# Altium schematic sheet 04_DRAM-LPDDR4X_200P_1X32bit.SchDoc
size 594 x 420 mm; SheetNumber: 4; SheetTotal: 10
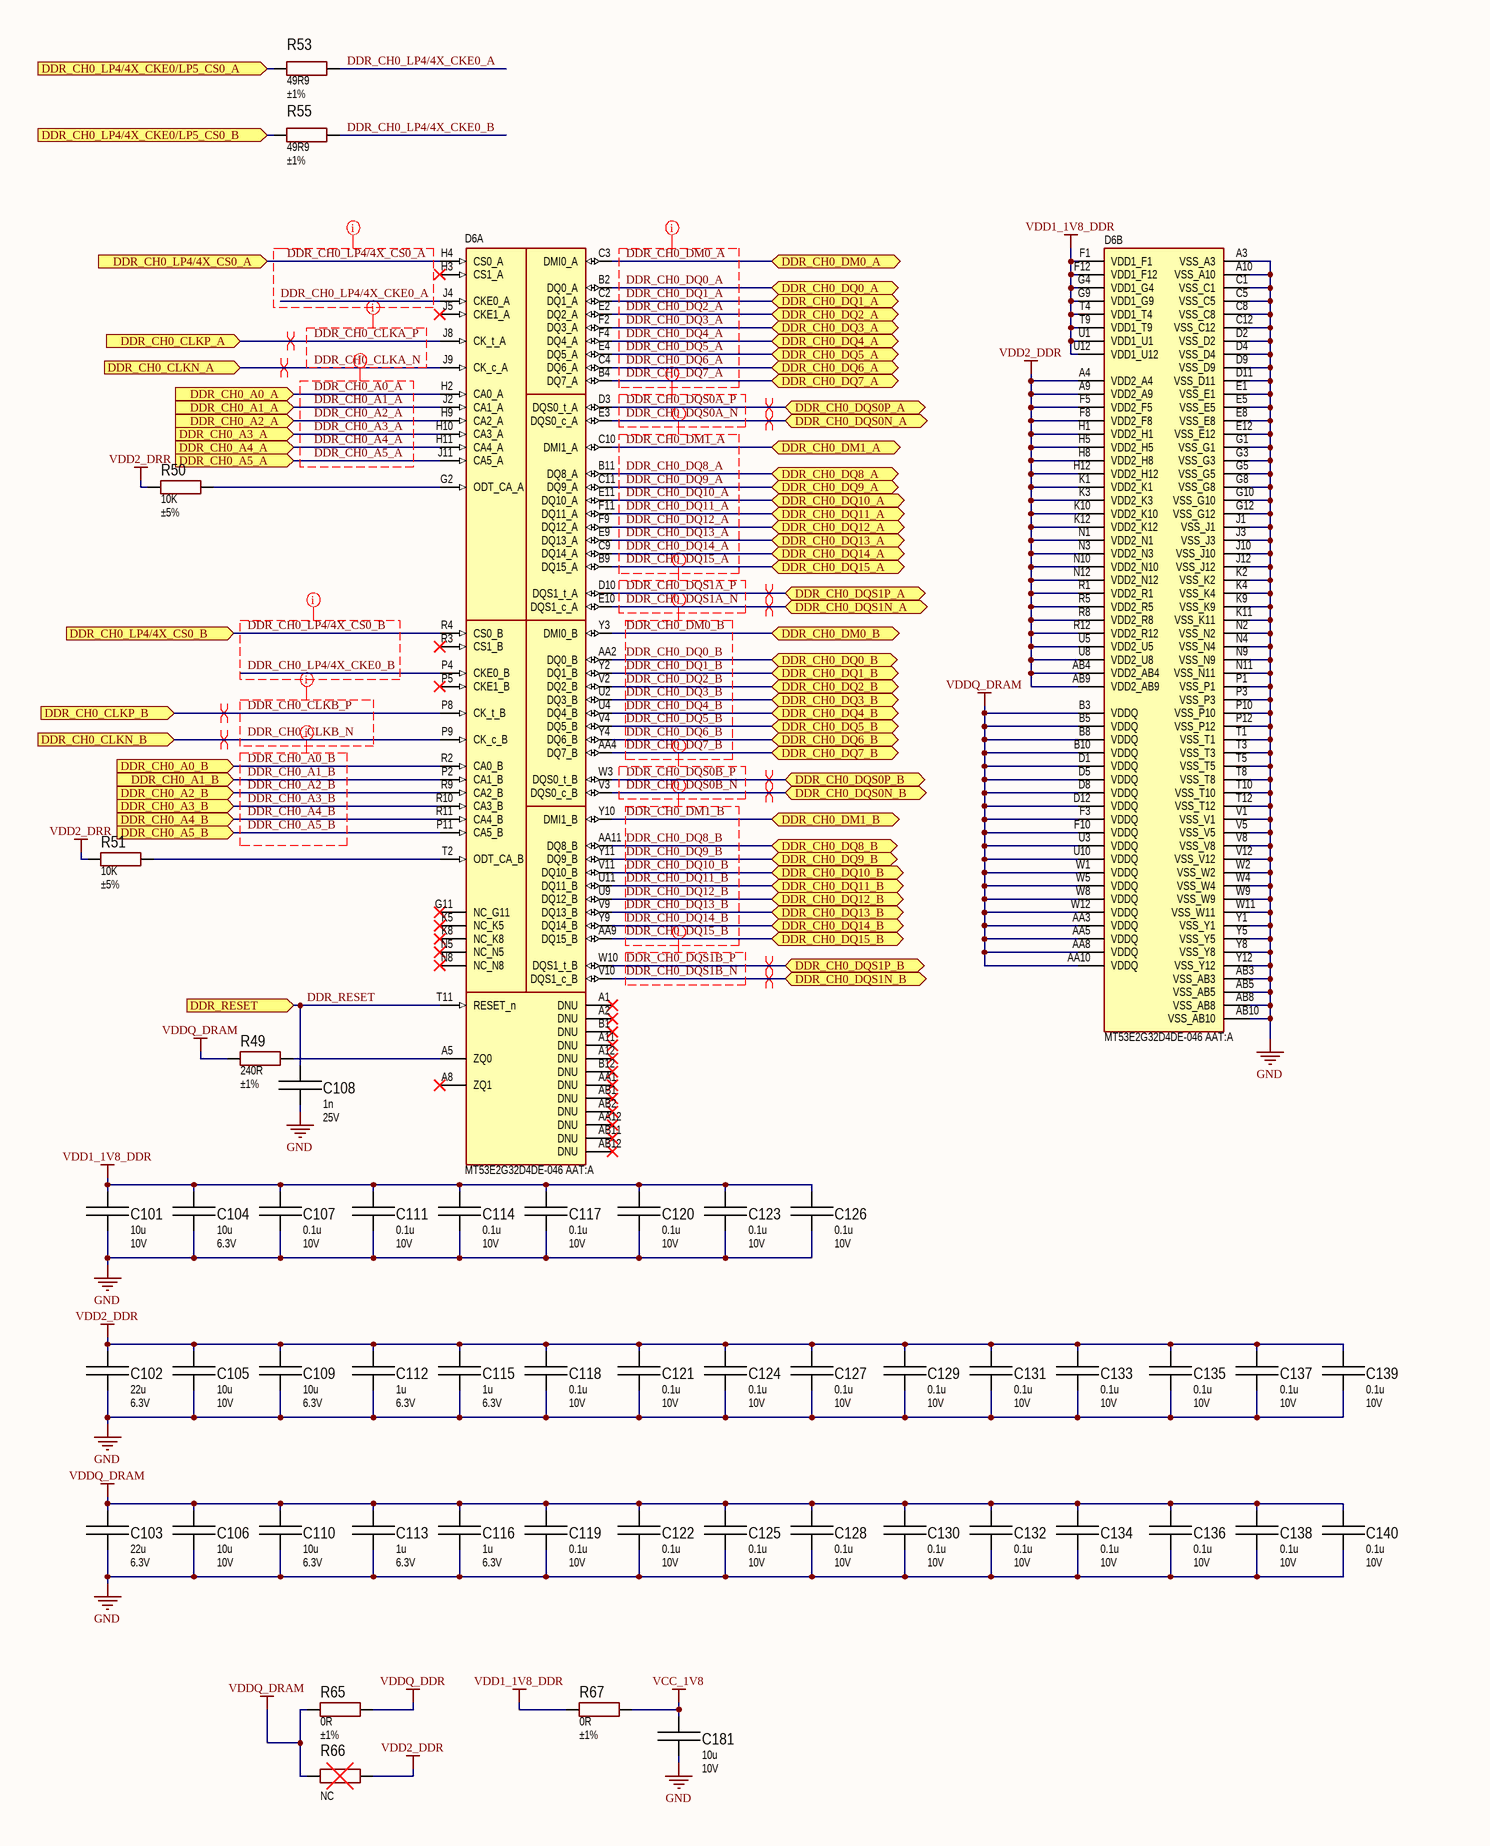
[diagram p0: 04_DRAM-LPDDR4X_200P_1X32bit.SchDoc, left]
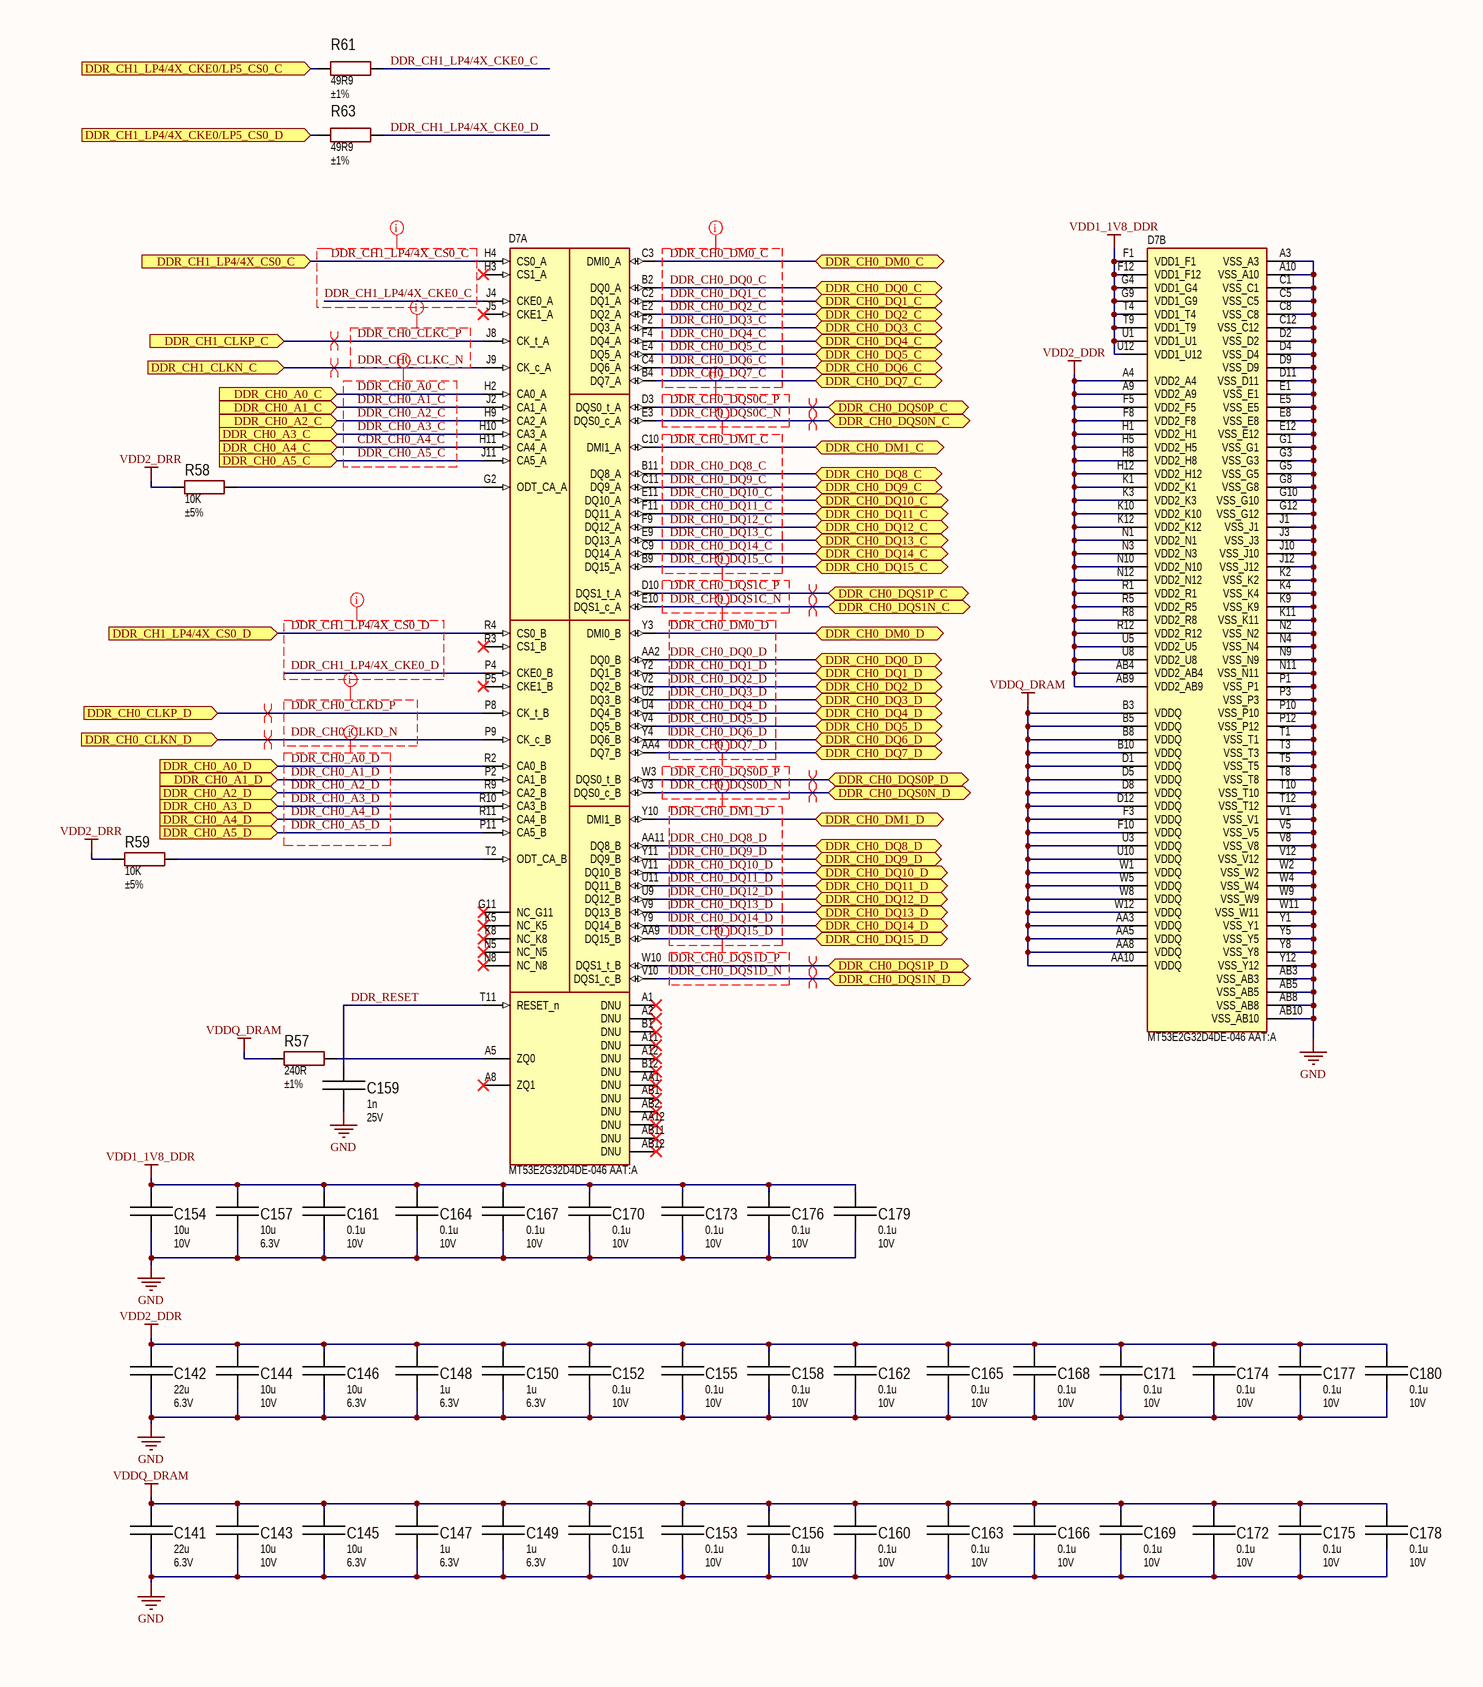
[diagram p1: 04_DRAM-LPDDR4X_200P_1X32bit.SchDoc, right]

## Parts
C101  value 10u  Voltage: 10V  [CAPC1608X08N]  (hidden comment: C1608X5R1A106K080AC)
C102  value 22u  Voltage: 6.3V  [CAPC1608X08N]  (hidden comment: C1608X5R0J226M080AC)
C103  value 22u  Voltage: 6.3V  [CAPC1608X08N]  (hidden comment: C1608X5R0J226M080AC)
C104  value 10u  Voltage: 6.3V  [CAPC1608X08N]  (hidden comment: C1608X5R0J106K080AB)
C105  value 10u  Voltage: 10V  [CAPC1608X08N]  (hidden comment: C1608X5R1A106K080AC)
C106  value 10u  Voltage: 10V  [CAPC1608X08N]  (hidden comment: C1608X5R1A106K080AC)
C107  value 0.1u  Voltage: 10V  [CAPC0603X03N]  (hidden comment: C0603X5R1A104K030BC)
C108  value 1n  Voltage: 25V  [CAPC0603X03N]  (hidden comment: C0603X5R1E102K030BA)
C109  value 10u  Voltage: 6.3V  [CAPC1608X08N]  (hidden comment: C1608X5R0J106K080AB)
C110  value 10u  Voltage: 6.3V  [CAPC1608X08N]  (hidden comment: C1608X5R0J106K080AB)
C111  value 0.1u  Voltage: 10V  [CAPC0603X03N]  (hidden comment: C0603X5R1A104K030BC)
C112  value 1u  Voltage: 6.3V  [CAPC1005X06N]  (hidden comment: C1005X5R0J105K050BB)
C113  value 1u  Voltage: 6.3V  [CAPC1005X06N]  (hidden comment: C1005X5R0J105K050BB)
C114  value 0.1u  Voltage: 10V  [CAPC0603X03N]  (hidden comment: C0603X5R1A104K030BC)
C115  value 1u  Voltage: 6.3V  [CAPC1005X06N]  (hidden comment: C1005X5R0J105K050BB)
C116  value 1u  Voltage: 6.3V  [CAPC1005X06N]  (hidden comment: C1005X5R0J105K050BB)
C117  value 0.1u  Voltage: 10V  [CAPC0603X03N]  (hidden comment: C0603X5R1A104K030BC)
C118  value 0.1u  Voltage: 10V  [CAPC0603X03N]  (hidden comment: C0603X5R1A104K030BC)
C119  value 0.1u  Voltage: 10V  [CAPC0603X03N]  (hidden comment: C0603X5R1A104K030BC)
C120  value 0.1u  Voltage: 10V  [CAPC0603X03N]  (hidden comment: C0603X5R1A104K030BC)
C121  value 0.1u  Voltage: 10V  [CAPC0603X03N]  (hidden comment: C0603X5R1A104K030BC)
C122  value 0.1u  Voltage: 10V  [CAPC0603X03N]  (hidden comment: C0603X5R1A104K030BC)
C123  value 0.1u  Voltage: 10V  [CAPC0603X03N]  (hidden comment: C0603X5R1A104K030BC)
C124  value 0.1u  Voltage: 10V  [CAPC0603X03N]  (hidden comment: C0603X5R1A104K030BC)
C125  value 0.1u  Voltage: 10V  [CAPC0603X03N]  (hidden comment: C0603X5R1A104K030BC)
C126  value 0.1u  Voltage: 10V  [CAPC0603X03N]  (hidden comment: C0603X5R1A104K030BC)
C127  value 0.1u  Voltage: 10V  [CAPC0603X03N]  (hidden comment: C0603X5R1A104K030BC)
C128  value 0.1u  Voltage: 10V  [CAPC0603X03N]  (hidden comment: C0603X5R1A104K030BC)
C129  value 0.1u  Voltage: 10V  [CAPC0603X03N]  (hidden comment: C0603X5R1A104K030BC)
C130  value 0.1u  Voltage: 10V  [CAPC0603X03N]  (hidden comment: C0603X5R1A104K030BC)
C131  value 0.1u  Voltage: 10V  [CAPC0603X03N]  (hidden comment: C0603X5R1A104K030BC)
C132  value 0.1u  Voltage: 10V  [CAPC0603X03N]  (hidden comment: C0603X5R1A104K030BC)
C133  value 0.1u  Voltage: 10V  [CAPC0603X03N]  (hidden comment: C0603X5R1A104K030BC)
C134  value 0.1u  Voltage: 10V  [CAPC0603X03N]  (hidden comment: C0603X5R1A104K030BC)
C135  value 0.1u  Voltage: 10V  [CAPC0603X03N]  (hidden comment: C0603X5R1A104K030BC)
C136  value 0.1u  Voltage: 10V  [CAPC0603X03N]  (hidden comment: C0603X5R1A104K030BC)
C137  value 0.1u  Voltage: 10V  [CAPC0603X03N]  (hidden comment: C0603X5R1A104K030BC)
C138  value 0.1u  Voltage: 10V  [CAPC0603X03N]  (hidden comment: C0603X5R1A104K030BC)
C139  value 0.1u  Voltage: 10V  [CAPC0603X03N]  (hidden comment: C0603X5R1A104K030BC)
C140  value 0.1u  Voltage: 10V  [CAPC0603X03N]  (hidden comment: C0603X5R1A104K030BC)
C141  value 22u  Voltage: 6.3V  [CAPC1608X08N]  (hidden comment: C1608X5R0J226M080AC)
C142  value 22u  Voltage: 6.3V  [CAPC1608X08N]  (hidden comment: C1608X5R0J226M080AC)
C143  value 10u  Voltage: 10V  [CAPC1608X08N]  (hidden comment: C1608X5R1A106K080AC)
C144  value 10u  Voltage: 10V  [CAPC1608X08N]  (hidden comment: C1608X5R1A106K080AC)
C145  value 10u  Voltage: 6.3V  [CAPC1608X08N]  (hidden comment: C1608X5R0J106K080AB)
C146  value 10u  Voltage: 6.3V  [CAPC1608X08N]  (hidden comment: C1608X5R0J106K080AB)
C147  value 1u  Voltage: 6.3V  [CAPC1005X06N]  (hidden comment: C1005X5R0J105K050BB)
C148  value 1u  Voltage: 6.3V  [CAPC1005X06N]  (hidden comment: C1005X5R0J105K050BB)
C149  value 1u  Voltage: 6.3V  [CAPC1005X06N]  (hidden comment: C1005X5R0J105K050BB)
C150  value 1u  Voltage: 6.3V  [CAPC1005X06N]  (hidden comment: C1005X5R0J105K050BB)
C151  value 0.1u  Voltage: 10V  [CAPC0603X03N]  (hidden comment: C0603X5R1A104K030BC)
C152  value 0.1u  Voltage: 10V  [CAPC0603X03N]  (hidden comment: C0603X5R1A104K030BC)
C153  value 0.1u  Voltage: 10V  [CAPC0603X03N]  (hidden comment: C0603X5R1A104K030BC)
C154  value 10u  Voltage: 10V  [CAPC1608X08N]  (hidden comment: C1608X5R1A106K080AC)
C155  value 0.1u  Voltage: 10V  [CAPC0603X03N]  (hidden comment: C0603X5R1A104K030BC)
C156  value 0.1u  Voltage: 10V  [CAPC0603X03N]  (hidden comment: C0603X5R1A104K030BC)
C157  value 10u  Voltage: 6.3V  [CAPC1608X08N]  (hidden comment: C1608X5R0J106K080AB)
C158  value 0.1u  Voltage: 10V  [CAPC0603X03N]  (hidden comment: C0603X5R1A104K030BC)
C159  value 1n  Voltage: 25V  [CAPC0603X03N]  (hidden comment: C0603X5R1E102K030BA)
C160  value 0.1u  Voltage: 10V  [CAPC0603X03N]  (hidden comment: C0603X5R1A104K030BC)
C161  value 0.1u  Voltage: 10V  [CAPC0603X03N]  (hidden comment: C0603X5R1A104K030BC)
C162  value 0.1u  Voltage: 10V  [CAPC0603X03N]  (hidden comment: C0603X5R1A104K030BC)
C163  value 0.1u  Voltage: 10V  [CAPC0603X03N]  (hidden comment: C0603X5R1A104K030BC)
C164  value 0.1u  Voltage: 10V  [CAPC0603X03N]  (hidden comment: C0603X5R1A104K030BC)
C165  value 0.1u  Voltage: 10V  [CAPC0603X03N]  (hidden comment: C0603X5R1A104K030BC)
C166  value 0.1u  Voltage: 10V  [CAPC0603X03N]  (hidden comment: C0603X5R1A104K030BC)
C167  value 0.1u  Voltage: 10V  [CAPC0603X03N]  (hidden comment: C0603X5R1A104K030BC)
C168  value 0.1u  Voltage: 10V  [CAPC0603X03N]  (hidden comment: C0603X5R1A104K030BC)
C169  value 0.1u  Voltage: 10V  [CAPC0603X03N]  (hidden comment: C0603X5R1A104K030BC)
C170  value 0.1u  Voltage: 10V  [CAPC0603X03N]  (hidden comment: C0603X5R1A104K030BC)
C171  value 0.1u  Voltage: 10V  [CAPC0603X03N]  (hidden comment: C0603X5R1A104K030BC)
C172  value 0.1u  Voltage: 10V  [CAPC0603X03N]  (hidden comment: C0603X5R1A104K030BC)
C173  value 0.1u  Voltage: 10V  [CAPC0603X03N]  (hidden comment: C0603X5R1A104K030BC)
C174  value 0.1u  Voltage: 10V  [CAPC0603X03N]  (hidden comment: C0603X5R1A104K030BC)
C175  value 0.1u  Voltage: 10V  [CAPC0603X03N]  (hidden comment: C0603X5R1A104K030BC)
C176  value 0.1u  Voltage: 10V  [CAPC0603X03N]  (hidden comment: C0603X5R1A104K030BC)
C177  value 0.1u  Voltage: 10V  [CAPC0603X03N]  (hidden comment: C0603X5R1A104K030BC)
C178  value 0.1u  Voltage: 10V  [CAPC0603X03N]  (hidden comment: C0603X5R1A104K030BC)
C179  value 0.1u  Voltage: 10V  [CAPC0603X03N]  (hidden comment: C0603X5R1A104K030BC)
C180  value 0.1u  Voltage: 10V  [CAPC0603X03N]  (hidden comment: C0603X5R1A104K030BC)
C181  value 10u  Voltage: 10V  [CAPC1608X08N]  (hidden comment: C1608X5R1A106K080AC)
D6  MT53E2G32D4DE-046 AAT:A  [BGA200C65P12X22_1000X1450X114]  (parts A,B of 2)
D7  MT53E2G32D4DE-046 AAT:A  [BGA200C65P12X22_1000X1450X114]  (parts A,B of 2)
R49  value 240R  Tolerance: ±1%  [RESC0603X02N]  (hidden comment: RC0201FR-07240RL)
R50  value 10K  Tolerance: ±5%  [RESC1005X04N]  (hidden comment: RC0402JR-0710KL)
R51  value 10K  Tolerance: ±5%  [RESC1005X04N]  (hidden comment: RC0402JR-0710KL)
R53  value 49R9  Tolerance: ±1%  [RESC0603X02N]  (hidden comment: RC0201FR-0749R9L)
R55  value 49R9  Tolerance: ±1%  [RESC0603X02N]  (hidden comment: RC0201FR-0749R9L)
R57  value 240R  Tolerance: ±1%  [RESC0603X02N]  (hidden comment: RC0201FR-07240RL)
R58  value 10K  Tolerance: ±5%  [RESC1005X04N]  (hidden comment: RC0402JR-0710KL)
R59  value 10K  Tolerance: ±5%  [RESC1005X04N]  (hidden comment: RC0402JR-0710KL)
R61  value 49R9  Tolerance: ±1%  [RESC0603X02N]  (hidden comment: RC0201FR-0749R9L)
R63  value 49R9  Tolerance: ±1%  [RESC0603X02N]  (hidden comment: RC0201FR-0749R9L)
R65  value 0R  Tolerance: ±1%  [RESC1608X05N]  (hidden comment: RC0603JR-070RL)
R66  value NC  [RESC1608X05N]  (hidden comment: NC0603)  (no BOM)
R67  value 0R  Tolerance: ±1%  [RESC1608X05N]  (hidden comment: RC0603JR-070RL)

## Ports
DDR_CH0_A0_A (in), DDR_CH0_A0_B (in), DDR_CH0_A0_C (in), DDR_CH0_A0_D (in), DDR_CH0_A1_A (in), DDR_CH0_A1_B (in), DDR_CH0_A1_C (in), DDR_CH0_A1_D (in), DDR_CH0_A2_A (in), DDR_CH0_A2_B (in), DDR_CH0_A2_C (in), DDR_CH0_A2_D (in), DDR_CH0_A3_A (in), DDR_CH0_A3_B (in), DDR_CH0_A3_C (in), DDR_CH0_A3_D (in), DDR_CH0_A4_A (in), DDR_CH0_A4_B (in), DDR_CH0_A4_C (in), DDR_CH0_A4_D (in), DDR_CH0_A5_A (in), DDR_CH0_A5_B (in), DDR_CH0_A5_C (in), DDR_CH0_A5_D (in), DDR_CH0_CLKN_A (in), DDR_CH0_CLKN_B (in), DDR_CH0_CLKN_D (in), DDR_CH0_CLKP_A (in), DDR_CH0_CLKP_B (in), DDR_CH0_CLKP_D (in), DDR_CH0_DM0_A (bidir), DDR_CH0_DM0_B (bidir), DDR_CH0_DM0_C (bidir), DDR_CH0_DM0_D (bidir), DDR_CH0_DM1_A (bidir), DDR_CH0_DM1_B (bidir), DDR_CH0_DM1_C (bidir), DDR_CH0_DM1_D (bidir), DDR_CH0_DQ0_A (bidir), DDR_CH0_DQ0_B (bidir), DDR_CH0_DQ0_C (bidir), DDR_CH0_DQ0_D (bidir), DDR_CH0_DQ1_A (bidir), DDR_CH0_DQ1_B (bidir), DDR_CH0_DQ1_C (bidir), DDR_CH0_DQ1_D (bidir), DDR_CH0_DQ2_A (bidir), DDR_CH0_DQ2_B (bidir), DDR_CH0_DQ2_C (bidir), DDR_CH0_DQ2_D (bidir), DDR_CH0_DQ3_A (bidir), DDR_CH0_DQ3_B (bidir), DDR_CH0_DQ3_C (bidir), DDR_CH0_DQ3_D (bidir), DDR_CH0_DQ4_A (bidir), DDR_CH0_DQ4_B (bidir), DDR_CH0_DQ4_C (bidir), DDR_CH0_DQ4_D (bidir), DDR_CH0_DQ5_A (bidir), DDR_CH0_DQ5_B (bidir), DDR_CH0_DQ5_C (bidir), DDR_CH0_DQ5_D (bidir), DDR_CH0_DQ6_A (bidir), DDR_CH0_DQ6_B (bidir), DDR_CH0_DQ6_C (bidir), DDR_CH0_DQ6_D (bidir), DDR_CH0_DQ7_A (bidir), DDR_CH0_DQ7_B (bidir), DDR_CH0_DQ7_C (bidir), DDR_CH0_DQ7_D (bidir), DDR_CH0_DQ8_A (bidir), DDR_CH0_DQ8_B (bidir), DDR_CH0_DQ8_C (bidir), DDR_CH0_DQ8_D (bidir), DDR_CH0_DQ9_A (bidir), DDR_CH0_DQ9_B (bidir), DDR_CH0_DQ9_C (bidir), DDR_CH0_DQ9_D (bidir), DDR_CH0_DQ10_A (bidir), DDR_CH0_DQ10_B (bidir), DDR_CH0_DQ10_C (bidir), DDR_CH0_DQ10_D (bidir), DDR_CH0_DQ11_A (bidir), DDR_CH0_DQ11_B (bidir), DDR_CH0_DQ11_C (bidir), DDR_CH0_DQ11_D (bidir), DDR_CH0_DQ12_A (bidir), DDR_CH0_DQ12_B (bidir), DDR_CH0_DQ12_C (bidir), DDR_CH0_DQ12_D (bidir), DDR_CH0_DQ13_A (bidir), DDR_CH0_DQ13_B (bidir), DDR_CH0_DQ13_C (bidir), DDR_CH0_DQ13_D (bidir), DDR_CH0_DQ14_A (bidir), DDR_CH0_DQ14_B (bidir), DDR_CH0_DQ14_C (bidir), DDR_CH0_DQ14_D (bidir), DDR_CH0_DQ15_A (bidir), DDR_CH0_DQ15_B (bidir), DDR_CH0_DQ15_C (bidir), DDR_CH0_DQ15_D (bidir), DDR_CH0_DQS0N_A (bidir), DDR_CH0_DQS0N_B (bidir), DDR_CH0_DQS0N_C (bidir), DDR_CH0_DQS0N_D (bidir), DDR_CH0_DQS0P_A (bidir), DDR_CH0_DQS0P_B (bidir), DDR_CH0_DQS0P_C (bidir), DDR_CH0_DQS0P_D (bidir), DDR_CH0_DQS1N_A (bidir), DDR_CH0_DQS1N_B (bidir), DDR_CH0_DQS1N_C (bidir), DDR_CH0_DQS1N_D (bidir), DDR_CH0_DQS1P_A (bidir), DDR_CH0_DQS1P_B (bidir), DDR_CH0_DQS1P_C (bidir), DDR_CH0_DQS1P_D (bidir), DDR_CH0_LP4/4X_CKE0/LP5_CS0_A (in), DDR_CH0_LP4/4X_CKE0/LP5_CS0_B (in), DDR_CH0_LP4/4X_CS0_A (in), DDR_CH0_LP4/4X_CS0_B (in), DDR_CH1_CLKN_C (in), DDR_CH1_CLKP_C (in), DDR_CH1_LP4/4X_CKE0/LP5_CS0_C (in), DDR_CH1_LP4/4X_CKE0/LP5_CS0_D (in), DDR_CH1_LP4/4X_CS0_C (in), DDR_CH1_LP4/4X_CS0_D (in), DDR_RESET (in)

## Nets
GND: C101.1 C102.1 C103.1 C104.1 C105.1 C106.1 C107.1 C108.1 C109.1 C110.1 C111.1 C112.1 C113.1 C114.1 C115.1 C116.1 C117.1 C118.1 C119.1 C120.1 C121.1 C122.1 C123.1 C124.1 C125.1 C126.1 C127.1 C128.1 C129.1 C130.1 C131.1 C132.1 C133.1 C134.1 C135.1 C136.1 C137.1 C138.1 C139.1 C140.1 C141.1 C142.1 C143.1 C144.1 C145.1 C146.1 C147.1 C148.1 C149.1 C150.1 C151.1 C152.1 C153.1 C154.1 C155.1 C156.1 C157.1 C158.1 C159.1 C160.1 C161.1 C162.1 C163.1 C164.1 C165.1 C166.1 C167.1 C168.1 C169.1 C170.1 C171.1 C172.1 C173.1 C174.1 C175.1 C176.1 C177.1 C178.1 C179.1 C180.1 C181.1 D6.A3(VSS_A3) D6.A10(VSS_A10) D6.AB3(VSS_AB3) D6.AB5(VSS_AB5) D6.AB8(VSS_AB8) D6.AB10(VSS_AB10) D6.C1(VSS_C1) D6.C5(VSS_C5) D6.C8(VSS_C8) D6.C12(VSS_C12) D6.D2(VSS_D2) D6.D4(VSS_D4) D6.D9(VSS_D9) D6.D11(VSS_D11) D6.E1(VSS_E1) D6.E5(VSS_E5) D6.E8(VSS_E8) D6.E12(VSS_E12) D6.G1(VSS_G1) D6.G3(VSS_G3) D6.G5(VSS_G5) D6.G8(VSS_G8) D6.G10(VSS_G10) D6.G12(VSS_G12) D6.J1(VSS_J1) D6.J3(VSS_J3) D6.J10(VSS_J10) D6.J12(VSS_J12) D6.K2(VSS_K2) D6.K4(VSS_K4) D6.K9(VSS_K9) D6.K11(VSS_K11) D6.N2(VSS_N2) D6.N4(VSS_N4) D6.N9(VSS_N9) D6.N11(VSS_N11) D6.P1(VSS_P1) D6.P3(VSS_P3) D6.P10(VSS_P10) D6.P12(VSS_P12) D6.T1(VSS_T1) D6.T3(VSS_T3) D6.T5(VSS_T5) D6.T8(VSS_T8) D6.T10(VSS_T10) D6.T12(VSS_T12) D6.V1(VSS_V1) D6.V5(VSS_V5) D6.V8(VSS_V8) D6.V12(VSS_V12) D6.W2(VSS_W2) D6.W4(VSS_W4) D6.W9(VSS_W9) D6.W11(VSS_W11) D6.Y1(VSS_Y1) D6.Y5(VSS_Y5) D6.Y8(VSS_Y8) D6.Y12(VSS_Y12) D7.A3(VSS_A3) D7.A10(VSS_A10) D7.AB3(VSS_AB3) D7.AB5(VSS_AB5) D7.AB8(VSS_AB8) D7.AB10(VSS_AB10) D7.C1(VSS_C1) D7.C5(VSS_C5) D7.C8(VSS_C8) D7.C12(VSS_C12) D7.D2(VSS_D2) D7.D4(VSS_D4) D7.D9(VSS_D9) D7.D11(VSS_D11) D7.E1(VSS_E1) D7.E5(VSS_E5) D7.E8(VSS_E8) D7.E12(VSS_E12) D7.G1(VSS_G1) D7.G3(VSS_G3) D7.G5(VSS_G5) D7.G8(VSS_G8) D7.G10(VSS_G10) D7.G12(VSS_G12) D7.J1(VSS_J1) D7.J3(VSS_J3) D7.J10(VSS_J10) D7.J12(VSS_J12) D7.K2(VSS_K2) D7.K4(VSS_K4) D7.K9(VSS_K9) D7.K11(VSS_K11) D7.N2(VSS_N2) D7.N4(VSS_N4) D7.N9(VSS_N9) D7.N11(VSS_N11) D7.P1(VSS_P1) D7.P3(VSS_P3) D7.P10(VSS_P10) D7.P12(VSS_P12) D7.T1(VSS_T1) D7.T3(VSS_T3) D7.T5(VSS_T5) D7.T8(VSS_T8) D7.T10(VSS_T10) D7.T12(VSS_T12) D7.V1(VSS_V1) D7.V5(VSS_V5) D7.V8(VSS_V8) D7.V12(VSS_V12) D7.W2(VSS_W2) D7.W4(VSS_W4) D7.W9(VSS_W9) D7.W11(VSS_W11) D7.Y1(VSS_Y1) D7.Y5(VSS_Y5) D7.Y8(VSS_Y8) D7.Y12(VSS_Y12)
VCC_1V8: C181.2 R67.2
VDD1_1V8_DDR: C101.2 C104.2 C107.2 C111.2 C114.2 C117.2 C120.2 C123.2 C126.2 C154.2 C157.2 C161.2 C164.2 C167.2 C170.2 C173.2 C176.2 C179.2 D6.F1(VDD1_F1) D6.F12(VDD1_F12) D6.G4(VDD1_G4) D6.G9(VDD1_G9) D6.T4(VDD1_T4) D6.T9(VDD1_T9) D6.U1(VDD1_U1) D6.U12(VDD1_U12) D7.F1(VDD1_F1) D7.F12(VDD1_F12) D7.G4(VDD1_G4) D7.G9(VDD1_G9) D7.T4(VDD1_T4) D7.T9(VDD1_T9) D7.U1(VDD1_U1) D7.U12(VDD1_U12) R67.1
VDD2_DDR: C102.2 C105.2 C109.2 C112.2 C115.2 C118.2 C121.2 C124.2 C127.2 C129.2 C131.2 C133.2 C135.2 C137.2 C139.2 C142.2 C144.2 C146.2 C148.2 C150.2 C152.2 C155.2 C158.2 C162.2 C165.2 C168.2 C171.2 C174.2 C177.2 C180.2 D6.A4(VDD2_A4) D6.A9(VDD2_A9) D6.AB4(VDD2_AB4) D6.AB9(VDD2_AB9) D6.F5(VDD2_F5) D6.F8(VDD2_F8) D6.H1(VDD2_H1) D6.H5(VDD2_H5) D6.H8(VDD2_H8) D6.H12(VDD2_H12) D6.K1(VDD2_K1) D6.K3(VDD2_K3) D6.K10(VDD2_K10) D6.K12(VDD2_K12) D6.N1(VDD2_N1) D6.N3(VDD2_N3) D6.N10(VDD2_N10) D6.N12(VDD2_N12) D6.R1(VDD2_R1) D6.R5(VDD2_R5) D6.R8(VDD2_R8) D6.R12(VDD2_R12) D6.U5(VDD2_U5) D6.U8(VDD2_U8) D7.A4(VDD2_A4) D7.A9(VDD2_A9) D7.AB4(VDD2_AB4) D7.AB9(VDD2_AB9) D7.F5(VDD2_F5) D7.F8(VDD2_F8) D7.H1(VDD2_H1) D7.H5(VDD2_H5) D7.H8(VDD2_H8) D7.H12(VDD2_H12) D7.K1(VDD2_K1) D7.K3(VDD2_K3) D7.K10(VDD2_K10) D7.K12(VDD2_K12) D7.N1(VDD2_N1) D7.N3(VDD2_N3) D7.N10(VDD2_N10) D7.N12(VDD2_N12) D7.R1(VDD2_R1) D7.R5(VDD2_R5) D7.R8(VDD2_R8) D7.R12(VDD2_R12) D7.U5(VDD2_U5) D7.U8(VDD2_U8) R66.2
VDD2_DRR: R50.1 R51.1 R58.1 R59.1
VDDQ_DDR: R65.2
VDDQ_DRAM: C103.2 C106.2 C110.2 C113.2 C116.2 C119.2 C122.2 C125.2 C128.2 C130.2 C132.2 C134.2 C136.2 C138.2 C140.2 C141.2 C143.2 C145.2 C147.2 C149.2 C151.2 C153.2 C156.2 C160.2 C163.2 C166.2 C169.2 C172.2 C175.2 C178.2 D6.AA3(VDDQ) D6.AA5(VDDQ) D6.AA8(VDDQ) D6.AA10(VDDQ) D6.B3(VDDQ) D6.B5(VDDQ) D6.B8(VDDQ) D6.B10(VDDQ) D6.D1(VDDQ) D6.D5(VDDQ) D6.D8(VDDQ) D6.D12(VDDQ) D6.F3(VDDQ) D6.F10(VDDQ) D6.U3(VDDQ) D6.U10(VDDQ) D6.W1(VDDQ) D6.W5(VDDQ) D6.W8(VDDQ) D6.W12(VDDQ) D7.AA3(VDDQ) D7.AA5(VDDQ) D7.AA8(VDDQ) D7.AA10(VDDQ) D7.B3(VDDQ) D7.B5(VDDQ) D7.B8(VDDQ) D7.B10(VDDQ) D7.D1(VDDQ) D7.D5(VDDQ) D7.D8(VDDQ) D7.D12(VDDQ) D7.F3(VDDQ) D7.F10(VDDQ) D7.U3(VDDQ) D7.U10(VDDQ) D7.W1(VDDQ) D7.W5(VDDQ) D7.W8(VDDQ) D7.W12(VDDQ) R49.1 R57.1 R65.1 R66.1
CDR_CH0_A4_C: D7.H11(CA4_A) ; port DDR_CH0_A4_C
DDR_CH0_A0_A: D6.H2(CA0_A) ; port DDR_CH0_A0_A
DDR_CH0_A0_B: D6.R2(CA0_B) ; port DDR_CH0_A0_B
DDR_CH0_A0_C: D7.H2(CA0_A) ; port DDR_CH0_A0_C
DDR_CH0_A0_D: D7.R2(CA0_B) ; port DDR_CH0_A0_D
DDR_CH0_A1_A: D6.J2(CA1_A) ; port DDR_CH0_A1_A
DDR_CH0_A1_B: D6.P2(CA1_B) ; port DDR_CH0_A1_B
DDR_CH0_A1_C: D7.J2(CA1_A) ; port DDR_CH0_A1_C
DDR_CH0_A1_D: D7.P2(CA1_B) ; port DDR_CH0_A1_D
DDR_CH0_A2_A: D6.H9(CA2_A) ; port DDR_CH0_A2_A
DDR_CH0_A2_B: D6.R9(CA2_B) ; port DDR_CH0_A2_B
DDR_CH0_A2_C: D7.H9(CA2_A) ; port DDR_CH0_A2_C
DDR_CH0_A2_D: D7.R9(CA2_B) ; port DDR_CH0_A2_D
DDR_CH0_A3_A: D6.H10(CA3_A) ; port DDR_CH0_A3_A
DDR_CH0_A3_B: D6.R10(CA3_B) ; port DDR_CH0_A3_B
DDR_CH0_A3_C: D7.H10(CA3_A) ; port DDR_CH0_A3_C
DDR_CH0_A3_D: D7.R10(CA3_B) ; port DDR_CH0_A3_D
DDR_CH0_A4_A: D6.H11(CA4_A) ; port DDR_CH0_A4_A
DDR_CH0_A4_B: D6.R11(CA4_B) ; port DDR_CH0_A4_B
DDR_CH0_A4_D: D7.R11(CA4_B) ; port DDR_CH0_A4_D
DDR_CH0_A5_A: D6.J11(CA5_A) ; port DDR_CH0_A5_A
DDR_CH0_A5_B: D6.P11(CA5_B) ; port DDR_CH0_A5_B
DDR_CH0_A5_C: D7.J11(CA5_A) ; port DDR_CH0_A5_C
DDR_CH0_A5_D: D7.P11(CA5_B) ; port DDR_CH0_A5_D
DDR_CH0_CLKA_N: D6.J9(CK_c_A) ; port DDR_CH0_CLKN_A
DDR_CH0_CLKA_P: D6.J8(CK_t_A) ; port DDR_CH0_CLKP_A
DDR_CH0_CLKB_N: D6.P9(CK_c_B) ; port DDR_CH0_CLKN_B
DDR_CH0_CLKB_P: D6.P8(CK_t_B) ; port DDR_CH0_CLKP_B
DDR_CH0_CLKC_N: D7.J9(CK_c_A) ; port DDR_CH1_CLKN_C
DDR_CH0_CLKC_P: D7.J8(CK_t_A) ; port DDR_CH1_CLKP_C
DDR_CH0_CLKD_N: D7.P9(CK_c_B) ; port DDR_CH0_CLKN_D
DDR_CH0_CLKD_P: D7.P8(CK_t_B) ; port DDR_CH0_CLKP_D
DDR_CH0_DM0_A: D6.C3(DMI0_A) ; port DDR_CH0_DM0_A
DDR_CH0_DM0_B: D6.Y3(DMI0_B) ; port DDR_CH0_DM0_B
DDR_CH0_DM0_C: D7.C3(DMI0_A) ; port DDR_CH0_DM0_C
DDR_CH0_DM0_D: D7.Y3(DMI0_B) ; port DDR_CH0_DM0_D
DDR_CH0_DM1_A: D6.C10(DMI1_A) ; port DDR_CH0_DM1_A
DDR_CH0_DM1_B: D6.Y10(DMI1_B) ; port DDR_CH0_DM1_B
DDR_CH0_DM1_C: D7.C10(DMI1_A) ; port DDR_CH0_DM1_C
DDR_CH0_DM1_D: D7.Y10(DMI1_B) ; port DDR_CH0_DM1_D
DDR_CH0_DQ0_A: D6.B2(DQ0_A) ; port DDR_CH0_DQ0_A
DDR_CH0_DQ0_B: D6.AA2(DQ0_B) ; port DDR_CH0_DQ0_B
DDR_CH0_DQ0_C: D7.B2(DQ0_A) ; port DDR_CH0_DQ0_C
DDR_CH0_DQ0_D: D7.AA2(DQ0_B) ; port DDR_CH0_DQ0_D
DDR_CH0_DQ1_A: D6.C2(DQ1_A) ; port DDR_CH0_DQ1_A
DDR_CH0_DQ1_B: D6.Y2(DQ1_B) ; port DDR_CH0_DQ1_B
DDR_CH0_DQ1_C: D7.C2(DQ1_A) ; port DDR_CH0_DQ1_C
DDR_CH0_DQ1_D: D7.Y2(DQ1_B) ; port DDR_CH0_DQ1_D
DDR_CH0_DQ2_A: D6.E2(DQ2_A) ; port DDR_CH0_DQ2_A
DDR_CH0_DQ2_B: D6.V2(DQ2_B) ; port DDR_CH0_DQ2_B
DDR_CH0_DQ2_C: D7.E2(DQ2_A) ; port DDR_CH0_DQ2_C
DDR_CH0_DQ2_D: D7.V2(DQ2_B) ; port DDR_CH0_DQ2_D
DDR_CH0_DQ3_A: D6.F2(DQ3_A) ; port DDR_CH0_DQ3_A
DDR_CH0_DQ3_B: D6.U2(DQ3_B) ; port DDR_CH0_DQ3_B
DDR_CH0_DQ3_C: D7.F2(DQ3_A) ; port DDR_CH0_DQ3_C
DDR_CH0_DQ3_D: D7.U2(DQ3_B) ; port DDR_CH0_DQ3_D
DDR_CH0_DQ4_A: D6.F4(DQ4_A) ; port DDR_CH0_DQ4_A
DDR_CH0_DQ4_B: D6.U4(DQ4_B) ; port DDR_CH0_DQ4_B
DDR_CH0_DQ4_C: D7.F4(DQ4_A) ; port DDR_CH0_DQ4_C
DDR_CH0_DQ4_D: D7.U4(DQ4_B) ; port DDR_CH0_DQ4_D
DDR_CH0_DQ5_A: D6.E4(DQ5_A) ; port DDR_CH0_DQ5_A
DDR_CH0_DQ5_B: D6.V4(DQ5_B) ; port DDR_CH0_DQ5_B
DDR_CH0_DQ5_C: D7.E4(DQ5_A) ; port DDR_CH0_DQ5_C
DDR_CH0_DQ5_D: D7.V4(DQ5_B) ; port DDR_CH0_DQ5_D
DDR_CH0_DQ6_A: D6.C4(DQ6_A) ; port DDR_CH0_DQ6_A
DDR_CH0_DQ6_B: D6.Y4(DQ6_B) ; port DDR_CH0_DQ6_B
DDR_CH0_DQ6_C: D7.C4(DQ6_A) ; port DDR_CH0_DQ6_C
DDR_CH0_DQ6_D: D7.Y4(DQ6_B) ; port DDR_CH0_DQ6_D
DDR_CH0_DQ7_A: D6.B4(DQ7_A) ; port DDR_CH0_DQ7_A
DDR_CH0_DQ7_B: D6.AA4(DQ7_B) ; port DDR_CH0_DQ7_B
DDR_CH0_DQ7_C: D7.B4(DQ7_A) ; port DDR_CH0_DQ7_C
DDR_CH0_DQ7_D: D7.AA4(DQ7_B) ; port DDR_CH0_DQ7_D
DDR_CH0_DQ8_A: D6.B11(DQ8_A) ; port DDR_CH0_DQ8_A
DDR_CH0_DQ8_B: D6.AA11(DQ8_B) ; port DDR_CH0_DQ8_B
DDR_CH0_DQ8_C: D7.B11(DQ8_A) ; port DDR_CH0_DQ8_C
DDR_CH0_DQ8_D: D7.AA11(DQ8_B) ; port DDR_CH0_DQ8_D
DDR_CH0_DQ9_A: D6.C11(DQ9_A) ; port DDR_CH0_DQ9_A
DDR_CH0_DQ9_B: D6.Y11(DQ9_B) ; port DDR_CH0_DQ9_B
DDR_CH0_DQ9_C: D7.C11(DQ9_A) ; port DDR_CH0_DQ9_C
DDR_CH0_DQ9_D: D7.Y11(DQ9_B) ; port DDR_CH0_DQ9_D
DDR_CH0_DQ10_A: D6.E11(DQ10_A) ; port DDR_CH0_DQ10_A
DDR_CH0_DQ10_B: D6.V11(DQ10_B) ; port DDR_CH0_DQ10_B
DDR_CH0_DQ10_C: D7.E11(DQ10_A) ; port DDR_CH0_DQ10_C
DDR_CH0_DQ10_D: D7.V11(DQ10_B) ; port DDR_CH0_DQ10_D
DDR_CH0_DQ11_A: D6.F11(DQ11_A) ; port DDR_CH0_DQ11_A
DDR_CH0_DQ11_B: D6.U11(DQ11_B) ; port DDR_CH0_DQ11_B
DDR_CH0_DQ11_C: D7.F11(DQ11_A) ; port DDR_CH0_DQ11_C
DDR_CH0_DQ11_D: D7.U11(DQ11_B) ; port DDR_CH0_DQ11_D
DDR_CH0_DQ12_A: D6.F9(DQ12_A) ; port DDR_CH0_DQ12_A
DDR_CH0_DQ12_B: D6.U9(DQ12_B) ; port DDR_CH0_DQ12_B
DDR_CH0_DQ12_C: D7.F9(DQ12_A) ; port DDR_CH0_DQ12_C
DDR_CH0_DQ12_D: D7.U9(DQ12_B) ; port DDR_CH0_DQ12_D
DDR_CH0_DQ13_A: D6.E9(DQ13_A) ; port DDR_CH0_DQ13_A
DDR_CH0_DQ13_B: D6.V9(DQ13_B) ; port DDR_CH0_DQ13_B
DDR_CH0_DQ13_C: D7.E9(DQ13_A) ; port DDR_CH0_DQ13_C
DDR_CH0_DQ13_D: D7.V9(DQ13_B) ; port DDR_CH0_DQ13_D
DDR_CH0_DQ14_A: D6.C9(DQ14_A) ; port DDR_CH0_DQ14_A
DDR_CH0_DQ14_B: D6.Y9(DQ14_B) ; port DDR_CH0_DQ14_B
DDR_CH0_DQ14_C: D7.C9(DQ14_A) ; port DDR_CH0_DQ14_C
DDR_CH0_DQ14_D: D7.Y9(DQ14_B) ; port DDR_CH0_DQ14_D
DDR_CH0_DQ15_A: D6.B9(DQ15_A) ; port DDR_CH0_DQ15_A
DDR_CH0_DQ15_B: D6.AA9(DQ15_B) ; port DDR_CH0_DQ15_B
DDR_CH0_DQ15_C: D7.B9(DQ15_A) ; port DDR_CH0_DQ15_C
DDR_CH0_DQ15_D: D7.AA9(DQ15_B) ; port DDR_CH0_DQ15_D
DDR_CH0_DQS0A_N: D6.E3(DQS0_c_A) ; port DDR_CH0_DQS0N_A
DDR_CH0_DQS0A_P: D6.D3(DQS0_t_A) ; port DDR_CH0_DQS0P_A
DDR_CH0_DQS0B_N: D6.V3(DQS0_c_B) ; port DDR_CH0_DQS0N_B
DDR_CH0_DQS0B_P: D6.W3(DQS0_t_B) ; port DDR_CH0_DQS0P_B
DDR_CH0_DQS0C_N: D7.E3(DQS0_c_A) ; port DDR_CH0_DQS0N_C
DDR_CH0_DQS0C_P: D7.D3(DQS0_t_A) ; port DDR_CH0_DQS0P_C
DDR_CH0_DQS0D_N: D7.V3(DQS0_c_B) ; port DDR_CH0_DQS0N_D
DDR_CH0_DQS0D_P: D7.W3(DQS0_t_B) ; port DDR_CH0_DQS0P_D
DDR_CH0_DQS1A_N: D6.E10(DQS1_c_A) ; port DDR_CH0_DQS1N_A
DDR_CH0_DQS1A_P: D6.D10(DQS1_t_A) ; port DDR_CH0_DQS1P_A
DDR_CH0_DQS1B_N: D6.V10(DQS1_c_B) ; port DDR_CH0_DQS1N_B
DDR_CH0_DQS1B_P: D6.W10(DQS1_t_B) ; port DDR_CH0_DQS1P_B
DDR_CH0_DQS1C_N: D7.E10(DQS1_c_A) ; port DDR_CH0_DQS1N_C
DDR_CH0_DQS1C_P: D7.D10(DQS1_t_A) ; port DDR_CH0_DQS1P_C
DDR_CH0_DQS1D_N: D7.V10(DQS1_c_B) ; port DDR_CH0_DQS1N_D
DDR_CH0_DQS1D_P: D7.W10(DQS1_t_B) ; port DDR_CH0_DQS1P_D
DDR_CH0_LP4/4X_CKE0/LP5_CS0_A: R53.1 ; port DDR_CH0_LP4/4X_CKE0/LP5_CS0_A
DDR_CH0_LP4/4X_CKE0/LP5_CS0_B: R55.1 ; port DDR_CH0_LP4/4X_CKE0/LP5_CS0_B
DDR_CH0_LP4/4X_CKE0_A: D6.J4(CKE0_A) R53.2
DDR_CH0_LP4/4X_CKE0_B: D6.P4(CKE0_B) R55.2
DDR_CH0_LP4/4X_CS0_A: D6.H4(CS0_A) ; port DDR_CH0_LP4/4X_CS0_A
DDR_CH0_LP4/4X_CS0_B: D6.R4(CS0_B) ; port DDR_CH0_LP4/4X_CS0_B
DDR_CH1_LP4/4X_CKE0/LP5_CS0_C: R61.1 ; port DDR_CH1_LP4/4X_CKE0/LP5_CS0_C
DDR_CH1_LP4/4X_CKE0/LP5_CS0_D: R63.1 ; port DDR_CH1_LP4/4X_CKE0/LP5_CS0_D
DDR_CH1_LP4/4X_CKE0_C: D7.J4(CKE0_A) R61.2
DDR_CH1_LP4/4X_CKE0_D: D7.P4(CKE0_B) R63.2
DDR_CH1_LP4/4X_CS0_C: D7.H4(CS0_A) ; port DDR_CH1_LP4/4X_CS0_C
DDR_CH1_LP4/4X_CS0_D: D7.R4(CS0_B) ; port DDR_CH1_LP4/4X_CS0_D
DDR_RESET: C108.2 C159.2 D6.T11(RESET_n) D7.T11(RESET_n) ; port DDR_RESET
NetD6_A5: D6.A5(ZQ0) R49.2
NetD6_G2: D6.G2(ODT_CA_A) R50.2
NetD6_T2: D6.T2(ODT_CA_B) R51.2
NetD7_A5: D7.A5(ZQ0) R57.2
NetD7_G2: D7.G2(ODT_CA_A) R58.2
NetD7_T2: D7.T2(ODT_CA_B) R59.2

Not connected (* = marked no-connect by the designer): D6 A1(DNU)* A2(DNU)* A8(ZQ1)* A11(DNU)* A12(DNU)* AA1(DNU)* AA12(DNU)* AB1(DNU)* AB2(DNU)* AB11(DNU)* AB12(DNU)* B1(DNU)* B12(DNU)* G11(NC_G11)* H3(CS1_A)* J5(CKE1_A)* K5(NC_K5)* K8(NC_K8)* N5(NC_N5)* N8(NC_N8)* P5(CKE1_B)* R3(CS1_B)*; D7 A1(DNU)* A2(DNU)* A8(ZQ1)* A11(DNU)* A12(DNU)* AA1(DNU)* AA12(DNU)* AB1(DNU)* AB2(DNU)* AB11(DNU)* AB12(DNU)* B1(DNU)* B12(DNU)* G11(NC_G11)* H3(CS1_A)* J5(CKE1_A)* K5(NC_K5)* K8(NC_K8)* N5(NC_N5)* N8(NC_N8)* P5(CKE1_B)* R3(CS1_B)*

## Layout directives
differential pair; differential pair class 82R: DDR_CH0_CLKA_P, DDR_CH0_CLKB_P, DDR_CH0_CLKC_P, DDR_CH0_CLKD_P, DDR_CH0_DQS0A_P, DDR_CH0_DQS0B_P, DDR_CH0_DQS0C_P, DDR_CH0_DQS0D_P, DDR_CH0_DQS1A_P, DDR_CH0_DQS1B_P, DDR_CH0_DQS1C_P, DDR_CH0_DQS1D_P
differential pair: DDR_CH0_CLKA_N, DDR_CH0_CLKC_N
net class DDR_CH0_CLKA: DDR_CH0_A0_A, DDR_CH0_A1_A, DDR_CH0_A2_A, DDR_CH0_A3_A, DDR_CH0_A4_A, DDR_CH0_A5_A
mark named DDR_CH0_CLKA: DDR_CH0_CLKA_N, DDR_CH0_CLKA_P
net class DDR_CH0_LP4: DDR_CH0_LP4/4X_CKE0_A, DDR_CH0_LP4/4X_CS0_A
net class DDR_CH0_LP4/4X_B: DDR_CH0_LP4/4X_CKE0_B, DDR_CH0_LP4/4X_CS0_B
mark named DDR_CH0_CLKB: DDR_CH0_CLKB_N, DDR_CH0_CLKB_P
net class DDR_CH0_A_B: DDR_CH0_A0_B, DDR_CH0_A1_B, DDR_CH0_A2_B, DDR_CH0_A3_B, DDR_CH0_A4_B, DDR_CH0_A5_B
net class DDR_CH0_DM0_A: DDR_CH0_DM0_A, DDR_CH0_DQ0_A, DDR_CH0_DQ1_A, DDR_CH0_DQ2_A, DDR_CH0_DQ3_A, DDR_CH0_DQ4_A, DDR_CH0_DQ5_A, DDR_CH0_DQ6_A, DDR_CH0_DQ7_A
mark named DDR_CH0_DQS0A: DDR_CH0_DQS0A_N, DDR_CH0_DQS0A_P
net class DDR_CH0_DM1_A: DDR_CH0_DM1_A, DDR_CH0_DQ8_A, DDR_CH0_DQ9_A, DDR_CH0_DQ10_A, DDR_CH0_DQ11_A, DDR_CH0_DQ12_A, DDR_CH0_DQ13_A, DDR_CH0_DQ14_A, DDR_CH0_DQ15_A
mark named DDR_CH0_DQS1A: DDR_CH0_DQS1A_N, DDR_CH0_DQS1A_P
net class DDR_CH0_DM0_B: DDR_CH0_DM0_B, DDR_CH0_DQ0_B, DDR_CH0_DQ1_B, DDR_CH0_DQ2_B, DDR_CH0_DQ3_B, DDR_CH0_DQ4_B, DDR_CH0_DQ5_B, DDR_CH0_DQ6_B, DDR_CH0_DQ7_B
mark named DDR_CH0_DQS0B: DDR_CH0_DQS0B_N, DDR_CH0_DQS0B_P
net class DDR_CH0_DM1_B: DDR_CH0_DM1_B, DDR_CH0_DQ8_B, DDR_CH0_DQ9_B, DDR_CH0_DQ10_B, DDR_CH0_DQ11_B, DDR_CH0_DQ12_B, DDR_CH0_DQ13_B, DDR_CH0_DQ14_B, DDR_CH0_DQ15_B
mark named DDR_CH0_DQS1B: DDR_CH0_DQS1B_N, DDR_CH0_DQS1B_P
differential pair; net class 82R: DDR_CH0_CLKB_N, DDR_CH0_CLKD_N, DDR_CH0_DQS0A_N, DDR_CH0_DQS0B_N, DDR_CH0_DQS0C_N, DDR_CH0_DQS0D_N, DDR_CH0_DQS1A_N, DDR_CH0_DQS1B_N, DDR_CH0_DQS1C_N, DDR_CH0_DQS1D_N
net class DDR_CH0_A_C: CDR_CH0_A4_C, DDR_CH0_A0_C, DDR_CH0_A1_C, DDR_CH0_A2_C, DDR_CH0_A3_C, DDR_CH0_A5_C
mark named DDR_CH0_CLKС: DDR_CH0_CLKC_N, DDR_CH0_CLKC_P
net class DDR_CH1_LP4/4X_C: DDR_CH1_LP4/4X_CKE0_C, DDR_CH1_LP4/4X_CS0_C
net class DDR_CH1_LP4/4X_D: DDR_CH1_LP4/4X_CKE0_D, DDR_CH1_LP4/4X_CS0_D
mark named DDR_CH0_CLKD: DDR_CH0_CLKD_N, DDR_CH0_CLKD_P
net class DDR_CH0_A_D: DDR_CH0_A0_D, DDR_CH0_A1_D, DDR_CH0_A2_D, DDR_CH0_A3_D, DDR_CH0_A4_D, DDR_CH0_A5_D
net class DDR_CH0_DM0_C: DDR_CH0_DM0_C, DDR_CH0_DQ0_C, DDR_CH0_DQ1_C, DDR_CH0_DQ2_C, DDR_CH0_DQ3_C, DDR_CH0_DQ4_C, DDR_CH0_DQ5_C, DDR_CH0_DQ6_C, DDR_CH0_DQ7_C
mark named DDR_CH0_DQS0C: DDR_CH0_DQS0C_N, DDR_CH0_DQS0C_P
net class DDR_CH0_DM1_C: DDR_CH0_DM1_C, DDR_CH0_DQ8_C, DDR_CH0_DQ9_C, DDR_CH0_DQ10_C, DDR_CH0_DQ11_C, DDR_CH0_DQ12_C, DDR_CH0_DQ13_C, DDR_CH0_DQ14_C, DDR_CH0_DQ15_C
mark named DDR_CH0_DQS1C: DDR_CH0_DQS1C_N, DDR_CH0_DQS1C_P
net class DDR_CH0_DM0_D: DDR_CH0_DM0_D, DDR_CH0_DQ0_D, DDR_CH0_DQ1_D, DDR_CH0_DQ2_D, DDR_CH0_DQ3_D, DDR_CH0_DQ4_D, DDR_CH0_DQ5_D, DDR_CH0_DQ6_D, DDR_CH0_DQ7_D
mark named DDR_CH0_DQS0D: DDR_CH0_DQS0D_N, DDR_CH0_DQS0D_P
net class DDR_CH0_DM1_D: DDR_CH0_DM1_D, DDR_CH0_DQ8_D, DDR_CH0_DQ9_D, DDR_CH0_DQ10_D, DDR_CH0_DQ11_D, DDR_CH0_DQ12_D, DDR_CH0_DQ13_D, DDR_CH0_DQ14_D, DDR_CH0_DQ15_D
mark named DDR_CH0_DQS1D: DDR_CH0_DQS1D_N, DDR_CH0_DQS1D_P

## Notes on the sheet
- DWG NO:
- REV:
- THIS DOCUMENT AND THE DATA DISCLOSED HEREIN OR
- HEREWITH IS THE PROPERTY OF ALTIUM LIMITED AND MAY
- BE FREELY DISTRIBUTED IN WHOLE. NO RIGHTS ARE
- RESERVED OR EXPRESS OR IMPLIED WARANTEE GIVEN.
- REVISION
- DESCRIPTION
- DATE
- APPROVED
- ENG:
- APPROVALS
- PROJECT
- DSN:
- CHK:
- REFERENCE DOCUMENTS
- PROJECT REVISION:
- TITLE
- DOCUMENT REVISION:
- DESIGN ITEM:
- BOM:
- FAB DWG:
- PCB DWG:
- ASSY DWG:
- SCALE:
- A2
- SIZE
- CAGE CODE
- FILE NAME
- DWG NO.
- SHEET
- OF
- REV

## Library data of the parts
C101 C105 C106 C143 C144 C154 C181 = C1608X5R1A106K080AC: Ceramic capacitor, 10uF, X5R, ±10%, 10V, 0603, -55...+85°C; Manufacturer: TDK; Type: Ceramic SMD; PartNumber: C1608X5R1A106K080AC; Dielectric: X5R; Tolerance: ±10%; Temperature: -55...+85°C; Package: 0603; ComponentLink1Description: Link; ComponentLink1URL: https://product.tdk.com/system/files/dam/doc/product/capacitor/ceramic/mlcc/catalog/mlcc_commercial_general_en.pdf; ComponentLink2Description: LocalLink; ComponentLink2URL: C:\Users\Public\Documents\Altium\datasheet\Capacitors\mlcc_commercial_general_en.pdf
C102 C103 C141 C142 = C1608X5R0J226M080AC: Ceramic capacitor, 22uF, X5R, ±20%, 6.3V, 0603, -55...+85°C; Manufacturer: TDK; Type: Ceramic SMD; PartNumber: C1608X5R0J226M080AC; Dielectric: X5R; Tolerance: ±20%; Temperature: -55...+85°C; Package: 0603; ComponentLink1Description: Link; ComponentLink1URL: https://product.tdk.com/system/files/dam/doc/product/capacitor/ceramic/mlcc/catalog/mlcc_commercial_general_en.pdf; ComponentLink2Description: LocalLink; ComponentLink2URL: C:\Users\Public\Documents\Altium\datasheet\Capacitors\mlcc_commercial_general_en.pdf
C104 C109 C110 C145 C146 C157 = C1608X5R0J106K080AB: Ceramic capacitor, 10uF, X5R, ±10%, 6.3V, 0603, -55...+85°C; Manufacturer: TDK; Type: Ceramic SMD; PartNumber: C1608X5R0J106K080AB; Dielectric: X5R; Tolerance: ±10%; Temperature: -55...+85°C; Package: 0603; ComponentLink1Description: Link; ComponentLink1URL: https://product.tdk.com/system/files/dam/doc/product/capacitor/ceramic/mlcc/catalog/mlcc_commercial_general_en.pdf; ComponentLink2Description: LocalLink; ComponentLink2URL: C:\Users\Public\Documents\Altium\datasheet\Capacitors\mlcc_commercial_general_en.pdf
C107 C111 C114 C117-C140 C151-C153 C155 C156 C158 C160-C180 = C0603X5R1A104K030BC: Ceramic capacitor, 0.1uF, X5R, ±10%, 10V, 0201, -55...+85°C; Manufacturer: TDK; Type: Ceramic SMD; PartNumber: C0603X5R1A104K030BC; Dielectric: X5R; Tolerance: ±10%; Temperature: -55...+85°C; Package: 0201; ComponentLink1Description: Link; ComponentLink1URL: https://product.tdk.com/system/files/dam/doc/product/capacitor/ceramic/mlcc/catalog/mlcc_commercial_general_en.pdf; ComponentLink2Description: LocalLink; ComponentLink2URL: C:\Users\Public\Documents\Altium\datasheet\Capacitors\mlcc_commercial_general_en.pdf
C108 C159 = C0603X5R1E102K030BA: Ceramic capacitor, 1nF, X5R, ±10%, 25V, 0201, -55...+85°C; Manufacturer: TDK; Type: Ceramic SMD; PartNumber: C0603X5R1E102K030BA; Dielectric: X5R; Tolerance: ±10%; Temperature: -55...+85°C; Package: 0201; ComponentLink1Description: Link; ComponentLink1URL: https://product.tdk.com/system/files/dam/doc/product/capacitor/ceramic/mlcc/catalog/mlcc_commercial_general_en.pdf; ComponentLink2Description: LocalLink; ComponentLink2URL: C:\Users\Public\Documents\Altium\datasheet\Capacitors\mlcc_commercial_general_en.pdf
C112 C113 C115 C116 C147-C150 = C1005X5R0J105K050BB: Ceramic capacitor, 1uF, X5R, ±10%, 6.3V, 0402, -55...+85°C; Manufacturer: TDK; Type: Ceramic SMD; PartNumber: C1005X5R0J105K050BB; Dielectric: X5R; Tolerance: ±10%; Temperature: -55...+85°C; Package: 0402; ComponentLink1Description: Link; ComponentLink1URL: https://product.tdk.com/en/system/files/dam/doc/product/capacitor/ceramic/mlcc/catalog/mlcc_commercial_general_en.pdf; ComponentLink2Description: LocalLink; ComponentLink2URL: C:\Users\Public\Documents\Altium\datasheet\Capacitors\mlcc_commercial_general_en.pdf
D6 D7 = MT53E2G32D4DE-046 AAT:A: LPDDR4 TFBGA-200; Manufacturer: Micron; Type: LPDDR4; Temperature: -40...+105°C; Package: TFBGA-200; ComponentLink1Description: Link; ComponentLink1URL: https://www.farnell.com/datasheets/3681594.pdf; ComponentLink2Description: LocalLink; ComponentLink2URL: C:\Users\Public\Documents\Altium\Datasheet\ICs\BIWINIndustrialLPDDR4X4266DatasheetV3.0_BWMZCX32H2A-64GI-X.pdf; PartNumber: MT53E2G32D4DE-046 AAT:A
R49 R57 = RC0201FR-07240RL: Resistor film, 240R, ±1%, 0201, 0.05W, -55...+125°C; Manufacturer: Yageo; PartNumber: RC0201FR-07240RL; Type: Resistor film; Power: 0.05W; ComponentLink1Description: Link; ComponentLink1URL: https://www.yageo.com/upload/media/product/productsearch/datasheet/rchip/PYu-RC_Group_51_RoHS_L_12.pdf; Temperature: -55...+125°C; Package: 0201; ComponentLink2Description: LocalLink; ComponentLink2URL: C:\Users\Public\Documents\Altium\Datasheet\Resistors\PYu-RC_Group_51_RoHS_L_12.pdf
R50 R51 R58 R59 = RC0402JR-0710KL: Resistor film, 10K, ±5%, 0402, 0.0625W, -55...+155°C; Manufacturer: Yageo; PartNumber: RC0402JR-0710KL; Type: Resistor film; Power: 0.0625W; ComponentLink1Description: Link; ComponentLink1URL: https://www.yageo.com/upload/media/product/productsearch/datasheet/rchip/PYu-RC_Group_51_RoHS_L_12.pdf; Temperature: -55...+155°C; Package: 0402; ComponentLink2Description: LocalLink; ComponentLink2URL: C:\Users\Public\Documents\Altium\Datasheet\Resistors\PYu-RC_Group_51_RoHS_L_12.pdf
R53 R55 R61 R63 = RC0201FR-0749R9L: Resistor film, 49R9, ±1%, 0201, 0.05W, -55...+125°C; Manufacturer: Yageo; PartNumber: RC0201FR-0749R9L; Type: Resistor film; Power: 0.05W; ComponentLink1Description: Link; ComponentLink1URL: https://www.yageo.com/upload/media/product/productsearch/datasheet/rchip/PYu-RC_Group_51_RoHS_L_12.pdf; Temperature: -55...+125°C; Package: 0201; ComponentLink2Description: LocalLink; ComponentLink2URL: C:\Users\Public\Documents\Altium\Datasheet\Resistors\PYu-RC_Group_51_RoHS_L_12.pdf
R65 R67 = RC0603JR-070RL: Resistor film, 0R, 0603, 0.1W, -55...+155°C; Manufacturer: Yageo; PartNumber: RC0603JR-070RL; Type: Resistor film; Power: 0.1W; ComponentLink1Description: Link; ComponentLink1URL: https://www.yageo.com/upload/media/product/productsearch/datasheet/rchip/PYu-RC_Group_51_RoHS_L_12.pdf; Temperature: -55...+155°C; Package: 0603; ComponentLink2Description: LocalLink; ComponentLink2URL: C:\Users\Public\Documents\Altium\Datasheet\Resistors\PYu-RC_Group_51_RoHS_L_12.pdf
R66 = NC0603: NC, No BOM; PartNumber: NC; Type: Resistor film; Package: 0603